# Altium schematic sheet 30_TIME_GNSS.SchDoc
size 209 x 148 mm
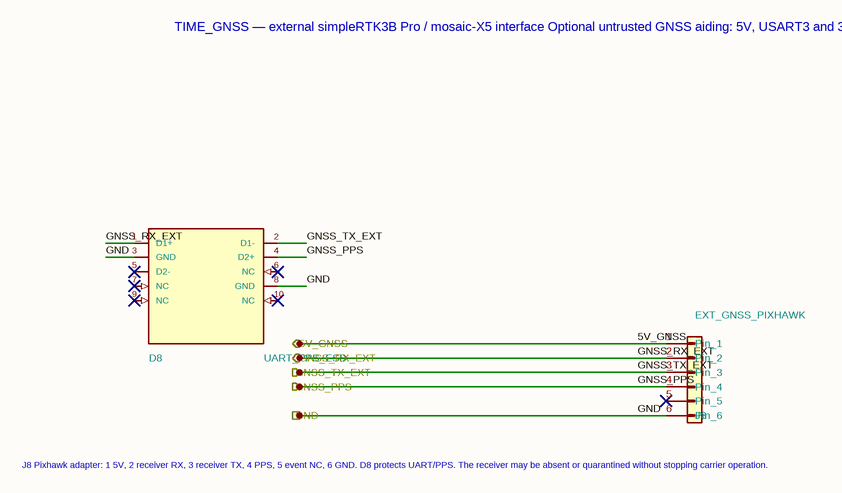
[diagram p0: 30_TIME_GNSS.SchDoc]

## Parts
D8  UART_PPS_ESD  [USON-10_2.5x1.0mm_P0.5mm]
J8  EXT_GNSS_PIXHAWK  [JST_GH_SM06B-GHS-TB_1x06-1MP_P1.25mm_Horizontal]

## Ports
5V_GNSS (in), GND, GNSS_PPS (out), GNSS_RX_EXT (in), GNSS_TX_EXT (out)

## Nets
5V_GNSS: J8.1(Pin_1) ; port 5V_GNSS
GND: D8.3(GND) D8.8(GND) J8.6(Pin_6) ; port GND
GNSS_PPS: D8.4(D2+) J8.4(Pin_4) ; port GNSS_PPS
GNSS_RX_EXT: D8.1(D1+) J8.2(Pin_2) ; port GNSS_RX_EXT
GNSS_TX_EXT: D8.2(D1-) J8.3(Pin_3) ; port GNSS_TX_EXT

Not connected (* = marked no-connect by the designer): D8 5(D2-)* 6(NC)* 7(NC)* 9(NC)* 10(NC)*; J8 5(Pin_5)*

## Notes on the sheet
- TIME_GNSS — external simpleRTK3B Pro / mosaic-X5 interface
  Optional untrusted GNSS aiding: 5V, USART3 and 3.3V PPS
- (near J8) J8 Pixhawk adapter: 1 5V, 2 receiver RX,
  3 receiver TX, 4 PPS, 5 event NC, 6 GND.
  D8 protects UART/PPS. The receiver may be absent
  or quarantined without stopping carrier operation.
- 1
- 2
- 3
- 4
- A
- B
- Title: EVT_SYS_CARRIER
- File: 30_TIME_GNSS.kicad_sch
- Sheet: /
- C
- KiCad E.D.A.  kicad (5.1.4)-1
- Size: A5
- Date:
- Rev:
- Id: 1/1

## Library data of the parts
D8 = TPD4E05U06DQAR: Capture_Status: LOCAL_CONTRACT_SYMBOL; hierarchy_path: /66980d89-56fb-4772-93a7-06a61d388399/9c5f5607-c07c-4d34-adbd-36601c2debbf; MPN: TPD4E05U06DQAR; Value: UART_PPS_ESD; Footprint: Package_SON:USON-10_2.5x1.0mm_P0.5mm
J8 = Conn_01x06: MPN: SM06B-GHS-TB(LF)(SN); hierarchy_path: /66980d89-56fb-4772-93a7-06a61d388399/9c5f5607-c07c-4d34-adbd-36601c2debbf; Value: EXT_GNSS_PIXHAWK; Footprint: Connector_JST:JST_GH_SM06B-GHS-TB_1x06-1MP_P1.25mm_Horizontal